# Altium project Zulu_a7_no_pmod.PrjPcb (part 3 of 3)
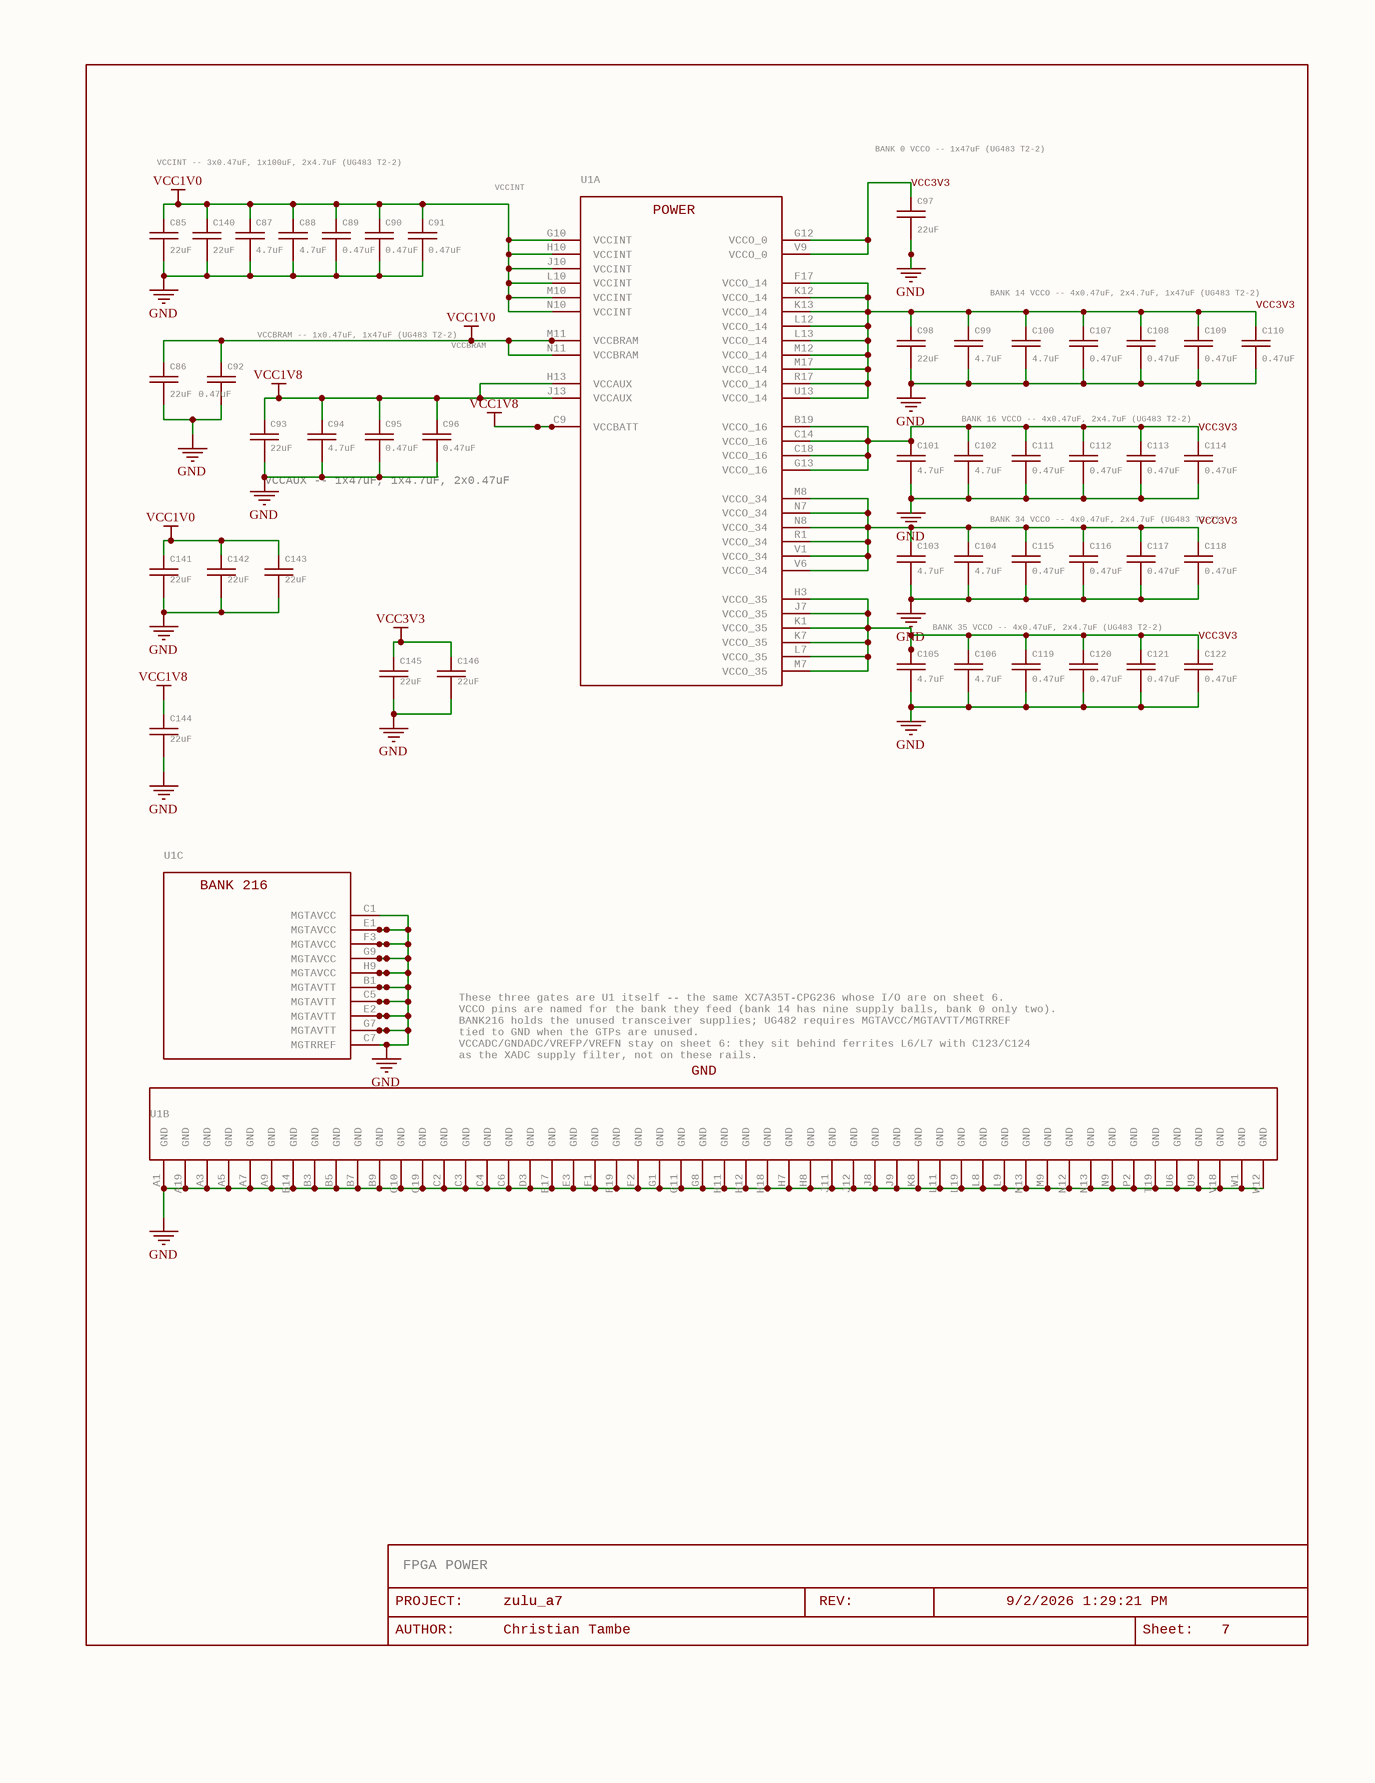
[diagram p7: zulu_a7_6.SchDoc]

## Nets that join several sheets
GND: zulu_a7_1 (32 pins), zulu_a7_2 (10 pins), zulu_a7_3 (28 pins), zulu_a7_4 (28 pins), zulu_a7_5 (9 pins), zulu_a7_6 (107 pins)
VCC1V0: zulu_a7_1 (C84.2 L3.2 U7.4), zulu_a7_2 (X2.20), zulu_a7_6 (20 pins)
VCC1V8: zulu_a7_1 (C82.2 L2.2 U6.4), zulu_a7_2 (X2.19), zulu_a7_5 (L7.1), zulu_a7_6 (8 pins)
VCC3V3: zulu_a7_1 (C80.2 L1.2 LD5.A U5.4), zulu_a7_2 (6 pins), zulu_a7_3 (32 pins), zulu_a7_4 (31 pins), zulu_a7_5 (R20.2 R23.1 U1.V11), zulu_a7_6 (55 pins)
VU: zulu_a7_1 (15 pins), zulu_a7_2 (X2.22)
A0: zulu_a7_3 (U3.23), zulu_a7_5 (U1.U2)
A1: zulu_a7_3 (U3.24), zulu_a7_5 (U1.T3)
A2: zulu_a7_3 (U3.25), zulu_a7_5 (U1.T2)
A3: zulu_a7_3 (U3.26), zulu_a7_5 (U1.T1)
A4: zulu_a7_3 (U3.29), zulu_a7_5 (U1.R3)
A5: zulu_a7_3 (U3.30), zulu_a7_5 (U1.R2)
A6: zulu_a7_3 (U3.31), zulu_a7_5 (U1.P3)
A7: zulu_a7_3 (U3.32), zulu_a7_5 (U1.P1)
A8: zulu_a7_3 (U3.33), zulu_a7_5 (U1.N3)
A9: zulu_a7_3 (U3.34), zulu_a7_5 (U1.N2)
A10: zulu_a7_3 (U3.22), zulu_a7_5 (U1.U3)
A11: zulu_a7_3 (U3.35), zulu_a7_5 (U1.N1)
A12: zulu_a7_3 (U3.36), zulu_a7_5 (U1.M3)
AIN15_N: zulu_a7_2 (C36.1 R13.1), zulu_a7_5 (U1.G2)
AIN15_P: zulu_a7_2 (C36.2 R12.1), zulu_a7_5 (U1.G3)
AIN16_N: zulu_a7_2 (C37.1 R17.1), zulu_a7_5 (U1.J2)
AIN16_P: zulu_a7_2 (C37.2 R16.1), zulu_a7_5 (U1.H2)
BS0: zulu_a7_3 (U3.20), zulu_a7_5 (U1.V2)
BS1: zulu_a7_3 (U3.21), zulu_a7_5 (U1.U1)
BTN: zulu_a7_2 (R85.2), zulu_a7_5 (U1.N19)
CAS#: zulu_a7_3 (U3.17), zulu_a7_5 (U1.W3)
CHAN0: zulu_a7_2 (X2.3), zulu_a7_5 (U1.B18)
CHAN1: zulu_a7_2 (X2.4), zulu_a7_5 (U1.A18)
CHAN2: zulu_a7_2 (X2.5), zulu_a7_5 (U1.B17)
CHAN3: zulu_a7_2 (X2.6), zulu_a7_5 (U1.A17)
CHAN4: zulu_a7_2 (X2.7), zulu_a7_5 (U1.C16)
CHAN5: zulu_a7_2 (X2.8), zulu_a7_5 (U1.D17)
CHAN6: zulu_a7_2 (X2.9), zulu_a7_5 (U1.H17)
CHAN7: zulu_a7_2 (X2.10), zulu_a7_5 (U1.G17)
CHAN8: zulu_a7_2 (X2.11), zulu_a7_5 (U1.J18)
CHAN9: zulu_a7_2 (X2.12), zulu_a7_5 (U1.J17)
CHAN10: zulu_a7_2 (X2.13), zulu_a7_5 (U1.J19)
CHAN11: zulu_a7_2 (X2.14), zulu_a7_5 (U1.K18)
CHAN12: zulu_a7_2 (X2.15), zulu_a7_5 (U1.E19)
CHAN13: zulu_a7_2 (X2.16), zulu_a7_5 (U1.H19)
CHAN14: zulu_a7_2 (X2.24), zulu_a7_5 (U1.W17)
CHAN15: zulu_a7_2 (X2.25), zulu_a7_5 (U1.V17)
CHAN16: zulu_a7_2 (X2.26), zulu_a7_5 (U1.W16)
CHAN17: zulu_a7_2 (X2.27), zulu_a7_5 (U1.U16)
CHAN18: zulu_a7_2 (X2.28), zulu_a7_5 (U1.V16)
CHAN19: zulu_a7_2 (X2.29), zulu_a7_5 (U1.W15)
CHAN20: zulu_a7_2 (X2.30), zulu_a7_5 (U1.V15)
CHAN21: zulu_a7_2 (X2.31), zulu_a7_5 (U1.U15)
CHAN22: zulu_a7_2 (X2.32), zulu_a7_5 (U1.W14)
CHAN23: zulu_a7_2 (X2.33), zulu_a7_5 (U1.V14)
CHAN24: zulu_a7_2 (X2.34), zulu_a7_5 (U1.U14)
CHAN25: zulu_a7_2 (X2.35), zulu_a7_5 (U1.W13)
CHAN26: zulu_a7_2 (X2.36), zulu_a7_5 (U1.V13)
CHAN27: zulu_a7_2 (X2.37), zulu_a7_5 (U1.T18)
CHAN28: zulu_a7_2 (X2.38), zulu_a7_5 (U1.T17)
CHAN-CLK: zulu_a7_2 (X2.2), zulu_a7_5 (U1.P18)
CKE: zulu_a7_3 (U3.37), zulu_a7_5 (U1.M2)
CLK-12M-FPGA: zulu_a7_4 (R25.2), zulu_a7_5 (U1.L17)
D0: zulu_a7_3 (U3.2), zulu_a7_5 (U1.V8)
D1: zulu_a7_3 (U3.4), zulu_a7_5 (U1.V7)
D2: zulu_a7_3 (U3.5), zulu_a7_5 (U1.W7)
D3: zulu_a7_3 (U3.7), zulu_a7_5 (U1.W6)
D4: zulu_a7_3 (U3.8), zulu_a7_5 (U1.U5)
D5: zulu_a7_3 (U3.10), zulu_a7_5 (U1.W5)
D6: zulu_a7_3 (U3.11), zulu_a7_5 (U1.V5)
D7: zulu_a7_3 (U3.13), zulu_a7_5 (U1.U4)
D8: zulu_a7_3 (U3.42), zulu_a7_5 (U1.L1)
D9: zulu_a7_3 (U3.44), zulu_a7_5 (U1.K3)
D10: zulu_a7_3 (U3.45), zulu_a7_5 (U1.K2)
D11: zulu_a7_3 (U3.47), zulu_a7_5 (U1.J1)
D12: zulu_a7_3 (U3.48), zulu_a7_5 (U1.J3)
D13: zulu_a7_3 (U3.50), zulu_a7_5 (U1.H1)
D14: zulu_a7_3 (U3.51), zulu_a7_5 (U1.A14)
D15: zulu_a7_3 (U3.53), zulu_a7_5 (U1.A15)
FLASH-CS#: zulu_a7_3 (R7.1 U4.1), zulu_a7_5 (U1.K19)
FLASH-D00: zulu_a7_3 (U4.5), zulu_a7_5 (U1.D18)
FLASH-D01: zulu_a7_3 (U4.2), zulu_a7_5 (U1.D19)
FLASH-D02: zulu_a7_3 (R2.1 U4.3), zulu_a7_5 (U1.G18)
FLASH-D03: zulu_a7_3 (R6.1 U4.7), zulu_a7_5 (U1.F18)
FPGA-CCLK: zulu_a7_3 (U4.6), zulu_a7_5 (U1.C11)
FPGA-DONE: zulu_a7_4 (R4.7 R4.15), zulu_a7_5 (U1.U12)
FPGA-INIT#: zulu_a7_4 (R1.1), zulu_a7_5 (U1.U11)
FPGA-TCK: zulu_a7_4 (R4.11 R5.2), zulu_a7_5 (U1.C8)
FPGA-TDI: zulu_a7_4 (R4.14), zulu_a7_5 (U1.W10)
FPGA-TDO: zulu_a7_4 (R4.13), zulu_a7_5 (U1.W8)
FPGA-TMS: zulu_a7_4 (R4.12), zulu_a7_5 (U1.W9)
FT-PWREN#: zulu_a7_4 (U2.60), zulu_a7_5 (U1.P19)
LDQM: zulu_a7_3 (U3.15), zulu_a7_5 (U1.W4)
LED0_B: zulu_a7_2 (LD0.2), zulu_a7_5 (U1.N17)
LED0_G: zulu_a7_2 (LD0.6), zulu_a7_5 (U1.R18)
LED0_R: zulu_a7_2 (LD0.4), zulu_a7_5 (U1.P17)
LED1: zulu_a7_2 (R83.1), zulu_a7_5 (U1.N18)
LED2: zulu_a7_2 (R84.1), zulu_a7_5 (U1.M19)
RAS#: zulu_a7_3 (U3.18), zulu_a7_5 (U1.V3)
RST#: zulu_a7_2 (X2.23), zulu_a7_4 (R1.2 R4.16), zulu_a7_5 (U1.V10)
SD-CLK: zulu_a7_3 (X3.5), zulu_a7_5 (U1.U8)
SD-CMD: zulu_a7_3 (R35.1 X3.3), zulu_a7_5 (U1.U7)
SD-DAT0: zulu_a7_3 (R34.1 X3.7), zulu_a7_5 (U1.C15)
SD-DAT1: zulu_a7_3 (R34.2 X3.8), zulu_a7_5 (U1.B15)
SD-DAT2: zulu_a7_3 (R34.3 X3.1), zulu_a7_5 (U1.L3)
SD-DAT3: zulu_a7_3 (R34.4 X3.2), zulu_a7_5 (U1.A16)
SDRAM-CLK: zulu_a7_3 (U3.38), zulu_a7_5 (U1.M1)
SDRAM-CS#: zulu_a7_3 (U3.19), zulu_a7_5 (U1.W2)
UART_FT_CTS#: zulu_a7_4 (R93.1 U2.41), zulu_a7_5 (U1.B16)
UART_FT_DTR#: zulu_a7_4 (U2.43), zulu_a7_5 (U1.M18)
UART_FT_RTS#: zulu_a7_4 (U2.40), zulu_a7_5 (U1.L18)
UART_FT_RXD: zulu_a7_4 (R94.1 U2.39), zulu_a7_5 (U1.G19)
UART_FT_TXD: zulu_a7_4 (U2.38), zulu_a7_5 (U1.K17)
UDQM: zulu_a7_3 (U3.39), zulu_a7_5 (U1.L2)
USB_D_N: zulu_a7_1 (X1.2), zulu_a7_4 (U2.7)
USB_D_P: zulu_a7_1 (X1.3), zulu_a7_4 (U2.8)
WE#: zulu_a7_3 (U3.16), zulu_a7_5 (U1.V4)